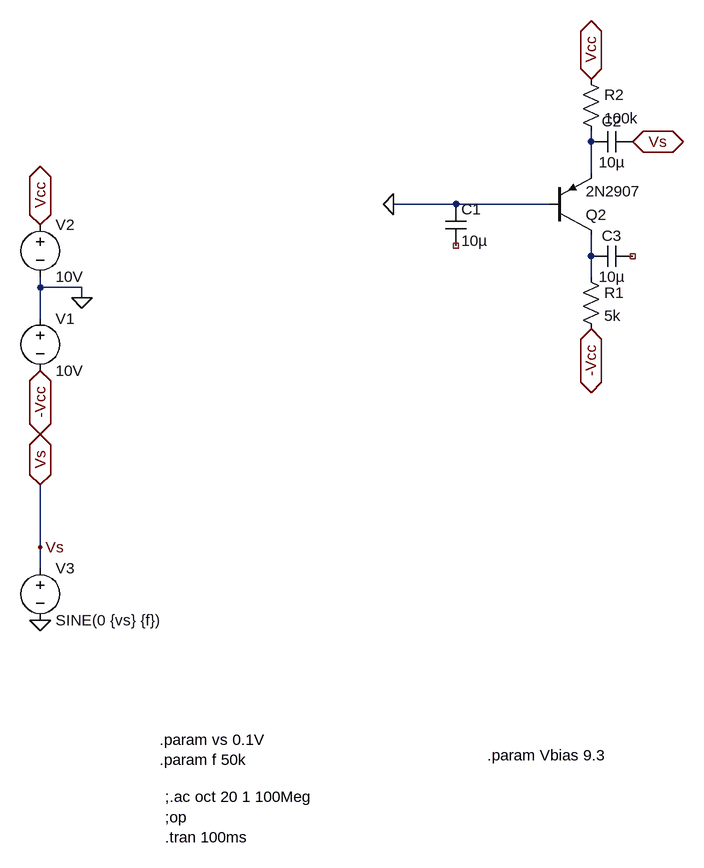
[diagram p0: schematic pnp_amplifier.asc]
pnp_amplifier.asc, the LTspice schematic file:
Version 4
SHEET 1 2336 816
WIRE 1200 -288 1200 -304
WIRE 1200 -240 1200 -288
WIRE 992 -192 896 -192
WIRE 1136 -192 992 -192
WIRE 1200 -112 1200 -144
WIRE 1200 -80 1200 -112
WIRE 352 -64 352 -80
WIRE 416 -64 352 -64
WIRE 416 -48 416 -64
WIRE 352 -16 352 -64
WIRE 352 336 352 240
WIRE 352 368 352 336
FLAG 416 -48 0
FLAG 352 64 -Vcc
IOPIN 352 64 BiDir
FLAG 352 -160 Vcc
IOPIN 352 -160 BiDir
FLAG 352 448 0
FLAG 352 336 Vs
FLAG 352 240 Vs
IOPIN 352 240 BiDir
FLAG 1200 0 -Vcc
IOPIN 1200 0 BiDir
FLAG 1200 -384 Vcc
IOPIN 1200 -384 BiDir
FLAG 896 -192 0
FLAG 1264 -288 Vs
IOPIN 1264 -288 BiDir
SYMBOL Voltage 352 -32 R0
SYMATTR InstName V1
SYMATTR Value 10V
SYMBOL Voltage 352 -176 R0
WINDOW 123 0 0 Left 0
WINDOW 39 0 0 Left 0
SYMATTR InstName V2
SYMATTR Value 10V
SYMBOL Voltage 352 352 R0
SYMATTR InstName V3
SYMATTR Value SINE(0 {vs} {f})
SYMATTR Value2 AC {vs}
SYMBOL pnp 1136 -144 M180
SYMATTR InstName Q2
SYMATTR Value 2N2907
SYMBOL Res 1184 -96 R0
SYMATTR InstName R1
SYMATTR Value 5k
SYMBOL Res 1184 -400 R0
SYMATTR InstName R2
SYMATTR Value 100k
SYMBOL Cap 976 -192 R0
SYMATTR InstName C1
SYMATTR Value 10µ
SYMBOL Cap 1264 -304 R90
WINDOW 0 0 32 VBottom 2
WINDOW 3 32 32 VTop 2
SYMATTR InstName C2
SYMATTR Value 10µ
SYMBOL Cap 1264 -128 R90
WINDOW 0 0 32 VBottom 2
WINDOW 3 32 32 VTop 2
SYMATTR InstName C3
SYMATTR Value 10µ
TEXT 536 632 Left 2 !.param vs 0.1V\n.param f 50k
TEXT 544 720 Left 2 !;.ac oct 20 1 100Meg\n;op\n.tran 100ms
TEXT 1040 656 Left 2 !.param Vbias 9.3

The netlist it stands for:
* pnp_amplifier.asc
V1 0 -Vcc 10V
V2 Vcc 0 10V
V3 Vs 0 SINE(0 {vs} {f}) AC {vs}
Q2 N002 0 N001 0 2N2907
R1 N002 -Vcc 5k
R2 Vcc N001 100k
C1 0 NC_01 10µ
C2 Vs N001 10µ
C3 NC_02 N002 10µ
.model NPN NPN
.model PNP PNP
.lib standard.bjt
.param vs 0.1V
.param f 50k
;.ac oct 20 1 100Meg
;op
.tran 100ms
.param Vbias 9.3
.backanno
.end